# Altium project Control-Boards-v2.0.PrjPcb (part 10 of 10)
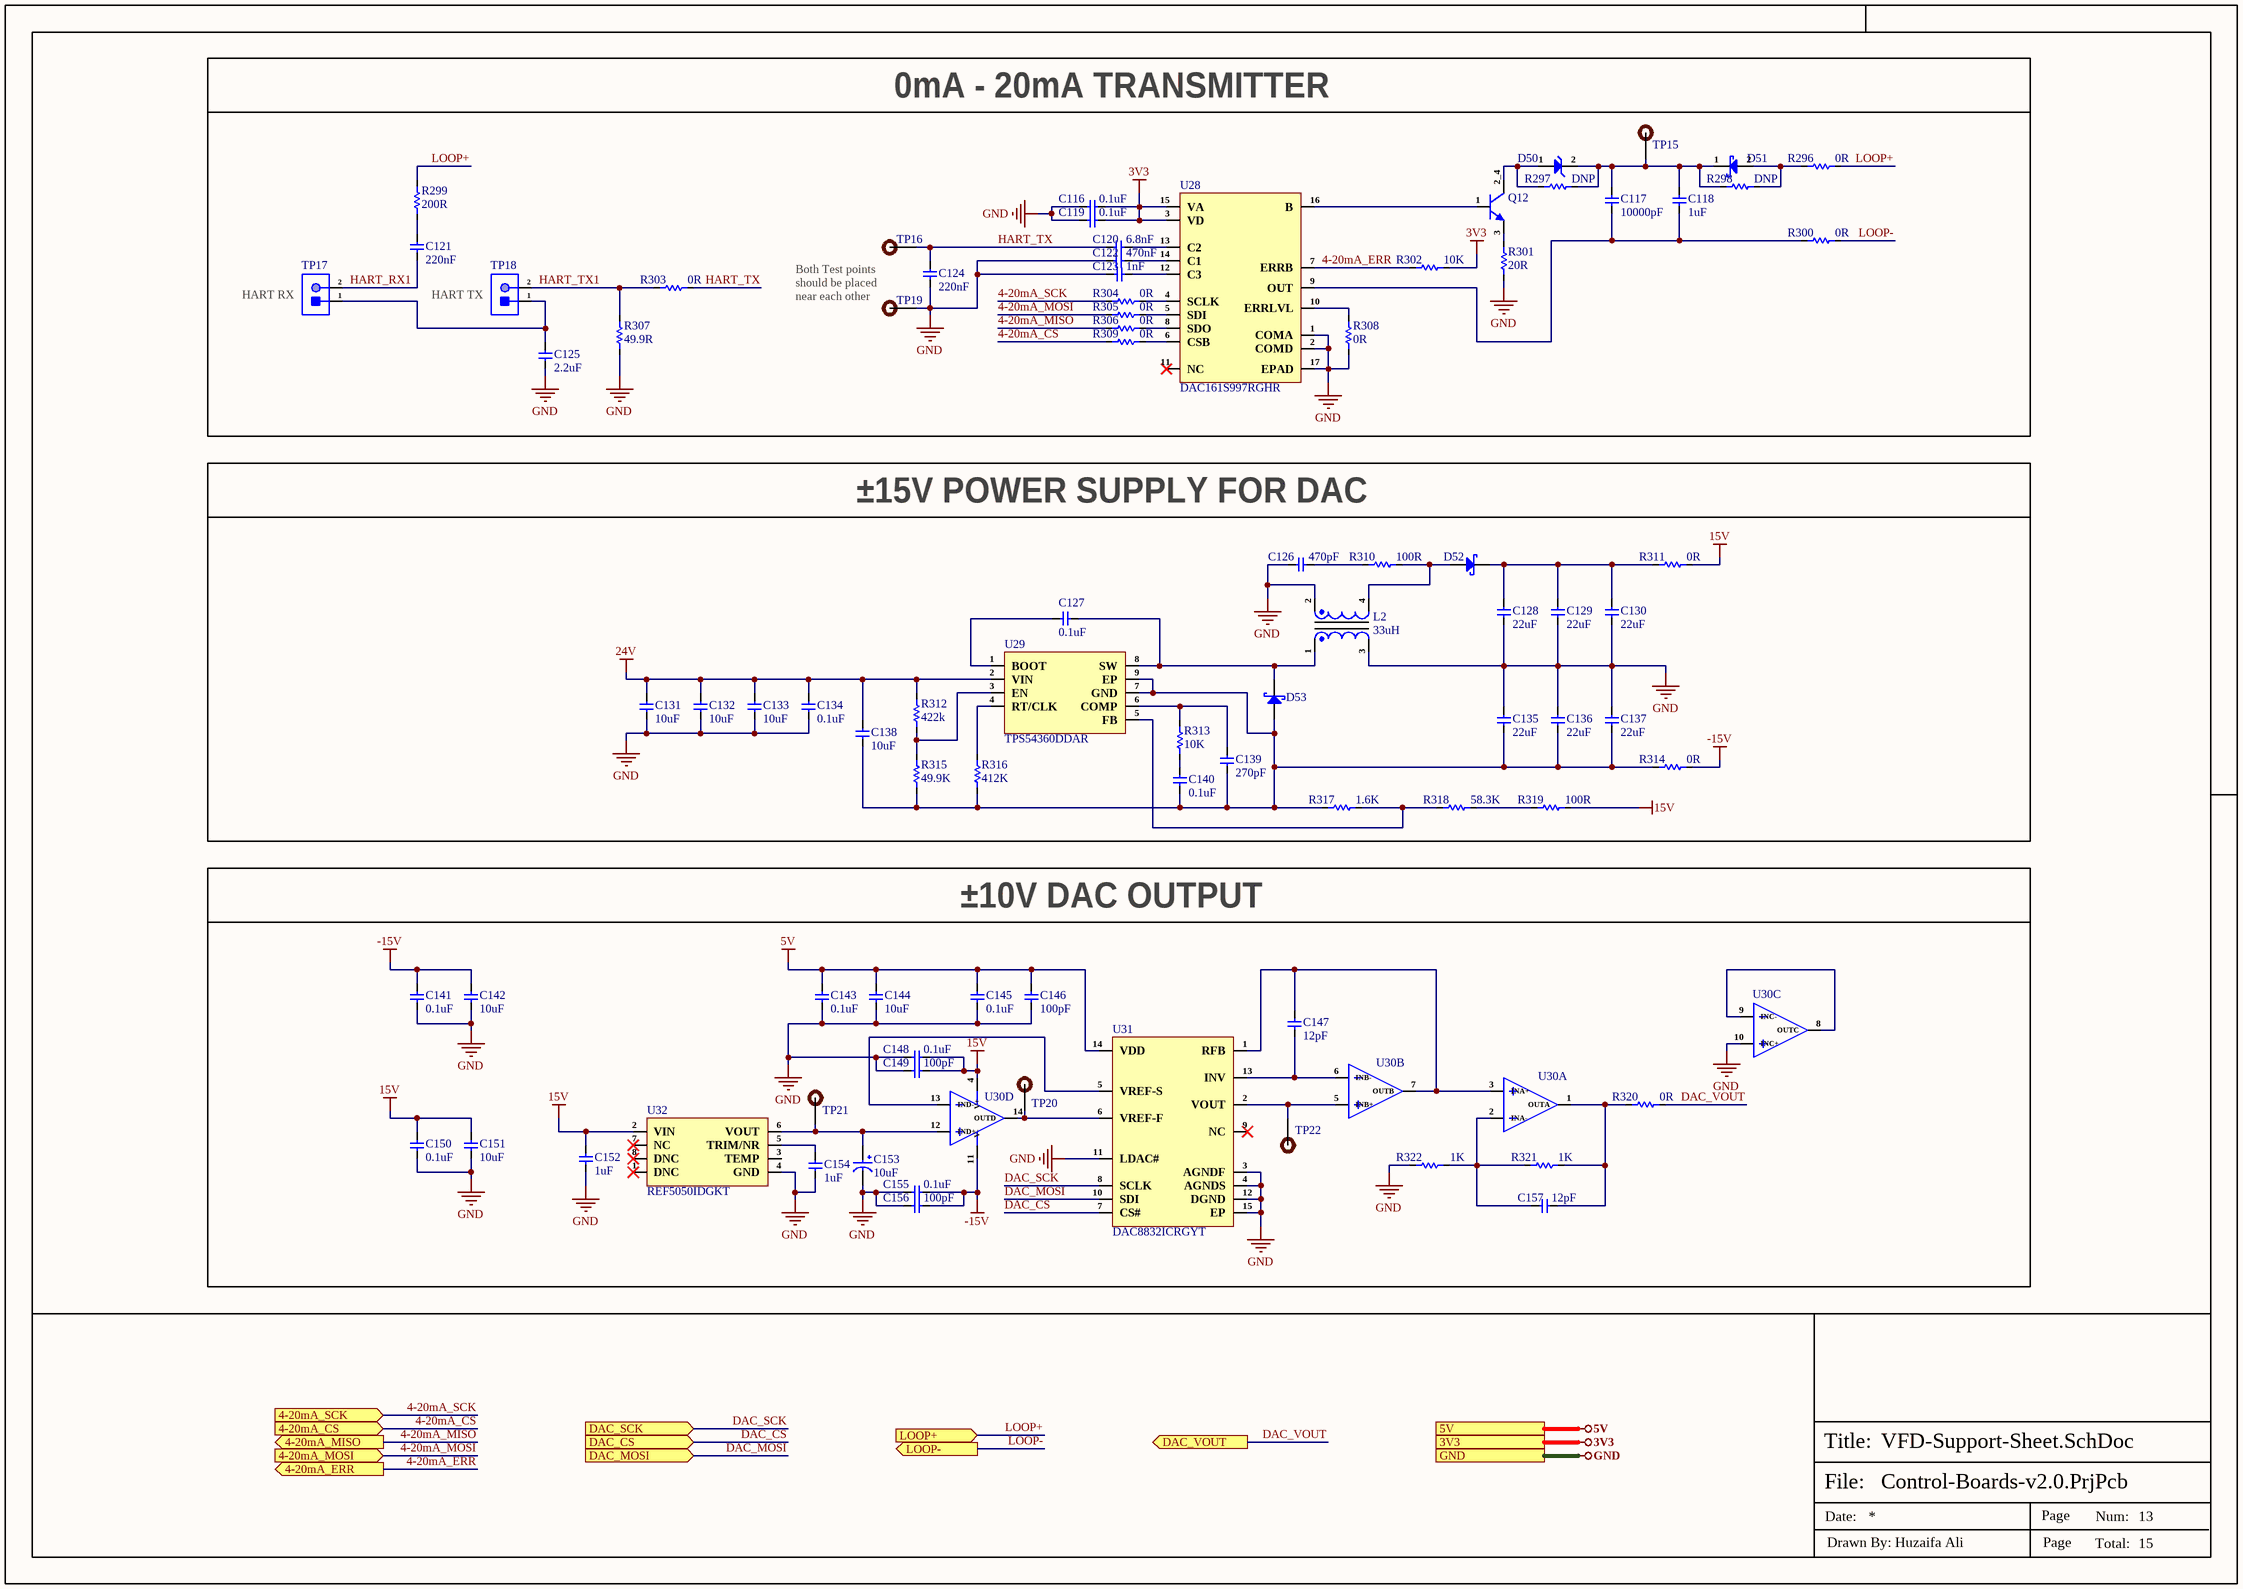
[diagram p16: VFD-Support-Sheet.SchDoc]

## Sheet VFD-Support-Sheet.SchDoc (continued)

### Library data of the parts (continued)
R312 = RT0805BRD07422KL: RES SMD 422K OHM 0.1% 1/8W 0805; Manufacturer: Yageo; Voltage Rating: 150V; Value: 422kR; Power Rating: 125mW; Temperature Coefficient: 25ppm/°C; Item Type: Resistor; Supplier 1: Digi-Key; Manufacturer Part Number: RT0805BRD07422KL; RoHS: Yes; Category: Chip SMD Resistors; Stock 1: 2917; Pricing 1: 1=0.38, 10=0.272, 100=0.1087, 500=0.07404, 1000=0.05357, 2500=0.04963 (USD); Case/Package: 0805; Case Code (Metric): 2012; Case Code (Imperial): 0805; Min Operating Temperature: -55°C; Max Operating Temperature: 155°C; Tolerance: 0.1%; Packaging: Tape and Reel; Termination: SMD/SMT; Voltage Rating (DC): 150V; Series: RT; Max Power Dissipation: 125mW; Number of Terminations: 2; Length: 2mm; Width: 1.25mm; Height: 500um; Lead Free: Lead Free; RoHS Compliant: Yes; ComponentLink1URL: https://datasheet.ciiva.com/12704/pyu-rt-1-to-0-05-rohs-l-4-12704463.pdf?src-supplier=Mouser; ComponentLink1Description: https://datasheet.ciiva.com/12704/pyu-rt-1-to-0-05-rohs-l-4-12704463.pdf?src-supplier=Mouser; Supplier Part Number 1: YAG4899CT-ND; LCSC Part Number: C865483
R315 = RC0805FR-0749K9L: RES 49.9K OHM 1% 1/8W 0805; Manufacturer: Yageo; Item Type: Resistor; Supplier: Future Electronics; Supplier Part Number: 3813284; Manufacturer Part Number: RC0805FR-0749K9L; RoHS: Yes; Category: Chip SMD Resistors; Stock: 665000; Pricing: 5000=0.0041, 25000=0.0025, 50000=0.0038, 125000=0.0024, 200000=0.0036, 500000=0.0023, 625000=0.0035, 1250000=0.0021, 2000000=0.0032 (USD); ComponentLink1URL: https://datasheet.ciiva.com/11808/0900766b8106beab-11808911.pdf?src-supplier=Rs; ComponentLink1Description: https://datasheet.ciiva.com/11808/0900766b8106beab-11808911.pdf?src-supplier=Rs; ComponentLink2URL: https://datasheet.ciiva.com/12656/rc0805-12656764.pdf?src-supplier=Mouser; ComponentLink2Description: https://datasheet.ciiva.com/12656/rc0805-12656764.pdf?src-supplier=Mouser; ComponentLink3URL: https://datasheet.ciiva.com/2456/pyu-r-int-thick-7-2456990.pdf?src-supplier=Digi-Key; ComponentLink3Description: https://datasheet.ciiva.com/2456/pyu-r-int-thick-7-2456990.pdf?src-supplier=Digi-Key; ComponentLink4URL: https://datasheet.ciiva.com/2456/pyu-r-int-thick-7-2456991.pdf?src-supplier=Digi-Key; ComponentLink4Description: https://datasheet.ciiva.com/2456/pyu-r-int-thick-7-2456991.pdf?src-supplier=Digi-Key; ComponentLink5URL: https://datasheet.ciiva.com/2456/pyu-r-int-thick-7-2456992.pdf?src-supplier=Digi-Key; ComponentLink5Description: https://datasheet.ciiva.com/2456/pyu-r-int-thick-7-2456992.pdf?src-supplier=Digi-Key; LCSC Part Number: C114540
R316 = RT0805BRD07412KL: RES SMD 412K OHM 0.1% 1/8W 0805; Manufacturer: Yageo; Item Type: Resistors; Value: 412kR; Power Rating: 125mW; Voltage Rating: 150V; Temperature Coefficient: 25ppm/°C; Supplier: Mouser; LCSC Part Number: C865478; Manufacturer Part Number: RT0805BRD07412KL; RoHS: Yes; Stock: 5000; Pricing: 1=0.16, 10=0.121, 50=0.095, 100=0.085, 1000=0.057, 10000=0.038 (USD); Case/Package: 0805; Case Code (Imperial): 0805; Case Code (Metric): 2012; Weight: 0.000194oz; Min Operating Temperature: -55°C; Max Operating Temperature: 155°C; Packaging: Tape and Reel; Tolerance: 0.1%; Termination: SMD/SMT; Voltage Rating (DC): 150V; Series: RT; Max Power Dissipation: 125mW; Number of Terminations: 2; Length: 2mm; Width: 1.2mm; Height: 0.5mm; Lead Free: Lead Free; RoHS Compliant: Yes; ComponentLink1URL: http://www.mouser.com/ds/2/447/yageodocoutput-1125656.pdf?src-supplier=Mouser; ComponentLink1Description: http://www.mouser.com/ds/2/447/yageodocoutput-1125656.pdf?src-supplier=Mouser; ComponentLink2URL: http://www.yageo.com/documents/recent/PYu-RT_1-to-0.01_RoHS_L_9.pdf?src-supplier=Digikey; ComponentLink2Description: http://www.yageo.com/documents/recent/PYu-RT_1-to-0.01_RoHS_L_9.pdf?src-supplier=Digikey
R317 = RT0402BRD071K6L: RES SMD 1.6K OHM 0.1% 1/16W 0402; Manufacturer: Yageo; Resistance: 1.6kR; Power Rating: 62.5mW; Voltage Rating: 50V; Temperature Coefficient: 25ppm/°C; Max Power Dissipation: 63mW; Item Type: Resistor; Supplier 1: Digi-Key; Manufacturer Part Number: RT0402BRD071K6L; RoHS: Yes; Category: Chip SMD Resistors; Stock 1: 20555; Pricing 1: 1=0.40000, 10=0.33600, 100=0.13130, 500=0.07938, 1000=0.05496, 2500=0.05038, 5000=0.04580 (USD); Case/Package: 0402; Case Code (Imperial): 0402; Case Code (Metric): 1005; Weight: 2.3E-05oz; Min Operating Temperature: -55°C; Max Operating Temperature: 125°C; Packaging: Tape and Reel; Tolerance: 0.1%; Package Quantity: 10000; Resistor Type: Thin Film; Termination: SMD/SMT; Number of Terminations: 2; Voltage Rating (DC): 50V; Series: RT; Length: 0.039inch; Width: 0.5mm; Height: 0.014inch; Lead Free: Lead Free; RoHS Compliant: Yes; ComponentLink1URL: https://datasheet.ciiva.com/2582/pyu-rt-1-to-0-05-rohs-l-5-2582211.pdf?src-supplier=Digi-Key; ComponentLink1Description: https://datasheet.ciiva.com/2582/pyu-rt-1-to-0-05-rohs-l-5-2582211.pdf?src-supplier=Digi-Key; LCSC Part Number: C852616; Supplier Part Number 1: YAG4199CT-ND
R318 = RT0402BRD0758K3L: RES SMD 58.3KOHM 0.1% 1/16W 0402; Manufacturer: Yageo; Item Type: Resistors; Supplier: Mouser; LCSC Part Number: C852851; Manufacturer Part Number: RT0402BRD0758K3L; RoHS: Yes; Stock: 10000; Pricing: 1=0.16, 10=0.121, 50=0.096, 100=0.086, 1000=0.057, 10000=0.038 (USD); ComponentLink1URL: https://datasheet.octopart.com/RT0402BRD0758K3L-Yageo-datasheet-164439670.pdf?src-supplier=Newark; ComponentLink1Description: https://datasheet.octopart.com/RT0402BRD0758K3L-Yageo-datasheet-164439670.pdf?src-supplier=Newark; ComponentLink2URL: http://www.yageo.com/documents/recent/PYu-RT_1-to-0.01_RoHS_L_9.pdf?src-supplier=Digikey; ComponentLink2Description: http://www.yageo.com/documents/recent/PYu-RT_1-to-0.01_RoHS_L_9.pdf?src-supplier=Digikey; ComponentLink3URL: https://www.yageo.com/upload/media/product/productsearch/datasheet/rchip/PYu-RT_1-to-0.01_RoHS_L_12.pdf?src-supplier=Digikey; ComponentLink3Description: https://www.yageo.com/upload/media/product/productsearch/datasheet/rchip/PYu-RT_1-to-0.01_RoHS_L_12.pdf?src-supplier=Digikey; ComponentLink4URL: https://datasheet.octopart.com/RT0402BRD0758K3L-Yageo-datasheet-166250672.pdf?src-supplier=Future+Electronics; ComponentLink4Description: https://datasheet.octopart.com/RT0402BRD0758K3L-Yageo-datasheet-166250672.pdf?src-supplier=Future+Electronics
R321 R322 = RC0402FR-071KL: RES 1K OHM 1% 1/16W 0402; Manufacturer: Yageo; Resistance: 1kR; Temperature Coefficient: 100ppm/°C; Voltage Rating (DC): 50V; Power Rating: 62.5mW; Max Power Dissipation: 63mW; Item Type: Resistor; Supplier 1: Avnet; Manufacturer Part Number: RC0402FR-071KL; RoHS: Yes; Category: Chip SMD Resistors; Stock 1: 13030000; Pricing 1: 10000=0.00085, 20000=0.00087, 40000=0.00084, 60000=0.00083, 80000=0.00079, 100000=0.00078, 1000000=0.00076 (USD); Case/Package: 0402; Number of Pins: 2; Case Code (Imperial): 0402; Case Code (Metric): 1005; Size Code: 0402; Min Operating Temperature: -55°C; Max Operating Temperature: 155°C; Resistor Type: Thick Film; Tolerance: 1%; Packaging: Tape and Reel; Voltage Rating: 50V; Termination: SMD/SMT; Features: Moisture Resistant; Series: RC; Number of Terminations: 2; Resistance Tolerance: 1%; Construction: Rectangular; Technology: THICK FILM; Length: 1mm; Width: 0.5mm; Height: 0.32mm; Depth: 0.5mm; Reach SVHC Compliant: Yes; Lead Free: Lead Free; RoHS Compliant: Yes; Military Standard: Not; ComponentLink1URL: https://datasheet.ciiva.com/11819/0900766b80c66297-11819477.pdf?src-supplier=RSComponents; ComponentLink1Description: https://datasheet.ciiva.com/11819/0900766b80c66297-11819477.pdf?src-supplier=RSComponents; ComponentLink2URL: https://datasheet.ciiva.com/7983/1018594-7983502.pdf?src-supplier=Element14; ComponentLink2Description: https://datasheet.ciiva.com/7983/1018594-7983502.pdf?src-supplier=Element14; ComponentLink3URL: https://datasheet.ciiva.com/22747/1018594-22747513.pdf?src-supplier=Element14; ComponentLink3Description: https://datasheet.ciiva.com/22747/1018594-22747513.pdf?src-supplier=Element14; ComponentLink4URL: https://datasheet.ciiva.com/12666/pyu-rc0402-51-rohs-l-6-r-12666741.pdf?src-supplier=Mouser; ComponentLink4Description: https://datasheet.ciiva.com/12666/pyu-rc0402-51-rohs-l-6-r-12666741.pdf?src-supplier=Mouser; ComponentLink5URL: https://datasheet.ciiva.com/7849/1018594-7849869.pdf?src-supplier=Element14; ComponentLink5Description: https://datasheet.ciiva.com/7849/1018594-7849869.pdf?src-supplier=Element14; ComponentLink6URL: https://datasheet.ciiva.com/7849/1018594-7849871.pdf?src-supplier=Element14; ComponentLink6Description: https://datasheet.ciiva.com/7849/1018594-7849871.pdf?src-supplier=Element14; ComponentLink7URL: https://datasheet.ciiva.com/17063/pyu-rc0402-51-rohs-l-6-r-17063193.pdf?src-supplier=Future+Electronics; ComponentLink7Description: https://datasheet.ciiva.com/17063/pyu-rc0402-51-rohs-l-6-r-17063193.pdf?src-supplier=Future+Electronics; Supplier Part Number 1: RC0402FR-071KL; LCSC Part Number: C106235
TP15 TP16 TP19-TP22 = TEST POINT: Test Point ON; Item Type: TEST POINT
TP17 TP18 = 2 Test Pad: Wire Connecting Pad; Item Type: Test Point; Manufacturer Part Number: 2 Test Pad
U28 = DAC161S997RGHR: IC DAC 16BIT 16WQFN; Manufacturer: Texas Instruments; Supplier: Mouser; LCSC Part Number: C90500; Manufacturer Part Number: DAC161S997RGHR; RoHS: Yes; Item Type: IC; Stock: 4693; Pricing: 1=5.54, 10=4.08, 50=4.08, 100=3.71, 1000=3.03, 10000=2.74 (USD); ComponentLink1URL: https://datasheet.ciiva.com/18633/dac161s997-18633093.pdf?src-supplier=Digikey; ComponentLink1Description: https://datasheet.ciiva.com/18633/dac161s997-18633093.pdf?src-supplier=Digikey; ComponentLink2URL: https://datasheet.ciiva.com/29897/dac161s997-29897307.pdf?src-supplier=Avnet; ComponentLink2Description: https://datasheet.ciiva.com/29897/dac161s997-29897307.pdf?src-supplier=Avnet
U29 = TPS54360DDAR: IC REG BCK SPLIT RAIL ADJ 8SOPWR; Manufacturer: Texas Instruments; Supplier: Mouser; LCSC Part Number: C44377; Manufacturer Part Number: TPS54360DDAR; RoHS: Yes; Item Type: IC; Stock: 2440; Pricing: 1=4.37, 10=3.05, 50=3.05, 100=2.76, 1000=2.47, 10000=2.31 (USD); ComponentLink1URL: https://datasheet.ciiva.com/12221/tps54360-109421-12221526.pdf?src-supplier=Mouser; ComponentLink1Description: https://datasheet.ciiva.com/12221/tps54360-109421-12221526.pdf?src-supplier=Mouser; ComponentLink2URL: https://datasheet.ciiva.com/14833/2976tps54360-14833745.pdf?src-supplier=Arrow+Electronics; ComponentLink2Description: https://datasheet.ciiva.com/14833/2976tps54360-14833745.pdf?src-supplier=Arrow+Electronics; ComponentLink3URL: https://datasheet.ciiva.com/14377/tps54360-14377976.pdf?src-supplier=Avnet; ComponentLink3Description: https://datasheet.ciiva.com/14377/tps54360-14377976.pdf?src-supplier=Avnet; ComponentLink4URL: https://datasheet.ciiva.com/41798/tps54360-41798794.pdf?src-supplier=Digikey; ComponentLink4Description: https://datasheet.ciiva.com/41798/tps54360-41798794.pdf?src-supplier=Digikey
U30 = OPA4192IPWR: IC OPAMP GP 4 CIRCUIT 14TSSOP; Manufacturer: Texas Instruments; Supplier: Mouser; LCSC Part Number: C2057935; Manufacturer Part Number: OPA4192IPWR; RoHS: Yes; Item Type: IC; Stock: 4607; Pricing: 1=6.33, 10=4.87, 50=4.5, 100=4.1, 1000=3.67, 10000=3.59 (USD); ComponentLink1URL: http://www.ti.com/general/docs/suppproductinfo.tsp?distId=10&amp;gotoUrl=http%3A%2F%2Fwww.ti.com%2Flit%2Fgpn%2Fopa4192&src-supplier=Digikey; ComponentLink1Description: http://www.ti.com/general/docs/suppproductinfo.tsp?distId=10&amp;gotoUrl=http%3A%2F%2Fwww.ti.com%2Flit%2Fgpn%2Fopa4192&src-supplier=Digikey; ComponentLink2URL: http://www.ti.com/lit/gpn/opa4192?src-supplier=Mouser; ComponentLink2Description: http://www.ti.com/lit/gpn/opa4192?src-supplier=Mouser
U31 = DAC8832ICRGYT: IC DAC 16BIT V-OUT 14VQFN; Manufacturer: Texas Instruments; Supplier: Mouser; LCSC Part Number: C2876764; Manufacturer Part Number: DAC8832ICRGYT; RoHS: Yes; Item Type: IC; Stock: 307; Pricing: 1=16.19, 10=12.83, 50=11.99, 100=11.06, 1000=10.23, 10000=10.23 (USD); ComponentLink1URL: https://datasheet.ciiva.com/12285/sbas380b-190797-12285552.pdf?src-supplier=Mouser; ComponentLink1Description: https://datasheet.ciiva.com/12285/sbas380b-190797-12285552.pdf?src-supplier=Mouser; ComponentLink2URL: https://datasheet.ciiva.com/15147/getdatasheetpartid-247745-15147072.pdf?src-supplier=Verical; ComponentLink2Description: https://datasheet.ciiva.com/15147/getdatasheetpartid-247745-15147072.pdf?src-supplier=Verical; ComponentLink3URL: https://datasheet.ciiva.com/41460/001186155-da-01-en-ic-dac-16bit-vo-dac8832icrgyt-qfn-14-tid-41460090.pdf?src-supplier=Conrad; ComponentLink3Description: https://datasheet.ciiva.com/41460/001186155-da-01-en-ic-dac-16bit-vo-dac8832icrgyt-qfn-14-tid-41460090.pdf?src-supplier=Conrad; ComponentLink4URL: https://datasheet.ciiva.com/14254/sbas380b-14254541.pdf?src-supplier=Avnet; ComponentLink4Description: https://datasheet.ciiva.com/14254/sbas380b-14254541.pdf?src-supplier=Avnet; ComponentLink5URL: https://datasheet.ciiva.com/1364/dac8832-1364376.pdf?src-supplier=Digikey; ComponentLink5Description: https://datasheet.ciiva.com/1364/dac8832-1364376.pdf?src-supplier=Digikey; ComponentLink6URL: https://datasheet.ciiva.com/1364/dac8832-1364377.pdf?src-supplier=Digikey; ComponentLink6Description: https://datasheet.ciiva.com/1364/dac8832-1364377.pdf?src-supplier=Digikey; ComponentLink7URL: https://datasheet.ciiva.com/1364/dac8832-1364378.pdf?src-supplier=Digikey; ComponentLink7Description: https://datasheet.ciiva.com/1364/dac8832-1364378.pdf?src-supplier=Digikey
U32 = REF5050IDGKT: IC VREF SERIES 0.05% 8VSSOP; Manufacturer: Texas Instruments; Supplier: Mouser; LCSC Part Number: C2156540; Manufacturer Part Number: REF5050IDGKT; RoHS: Yes; Item Type: IC; Stock: 701; Pricing: 1=7.97, 10=6.18, 50=5.73, 100=5.23, 1000=4.86, 10000=4.86 (USD); ComponentLink1URL: https://datasheet.ciiva.com/22666/1885920-22666106.pdf?src-supplier=Element14; ComponentLink1Description: https://datasheet.ciiva.com/22666/1885920-22666106.pdf?src-supplier=Element14; ComponentLink2URL: https://datasheet.ciiva.com/2007/ref5020-2007552.pdf?src-supplier=Digikey; ComponentLink2Description: https://datasheet.ciiva.com/2007/ref5020-2007552.pdf?src-supplier=Digikey; ComponentLink3URL: https://datasheet.ciiva.com/2007/ref5020-2007553.pdf?src-supplier=Digikey; ComponentLink3Description: https://datasheet.ciiva.com/2007/ref5020-2007553.pdf?src-supplier=Digikey; ComponentLink4URL: https://datasheet.ciiva.com/2007/ref5020-2007554.pdf?src-supplier=Digikey; ComponentLink4Description: https://datasheet.ciiva.com/2007/ref5020-2007554.pdf?src-supplier=Digikey; ComponentLink5URL: https://datasheet.ciiva.com/14197/ref5050-14197087.pdf?src-supplier=Avnet; ComponentLink5Description: https://datasheet.ciiva.com/14197/ref5050-14197087.pdf?src-supplier=Avnet

## Sheet VFD-Support-Sheet2.SchDoc
size 420 x 297 mm; SheetNumber: 14; SheetTotal: 15
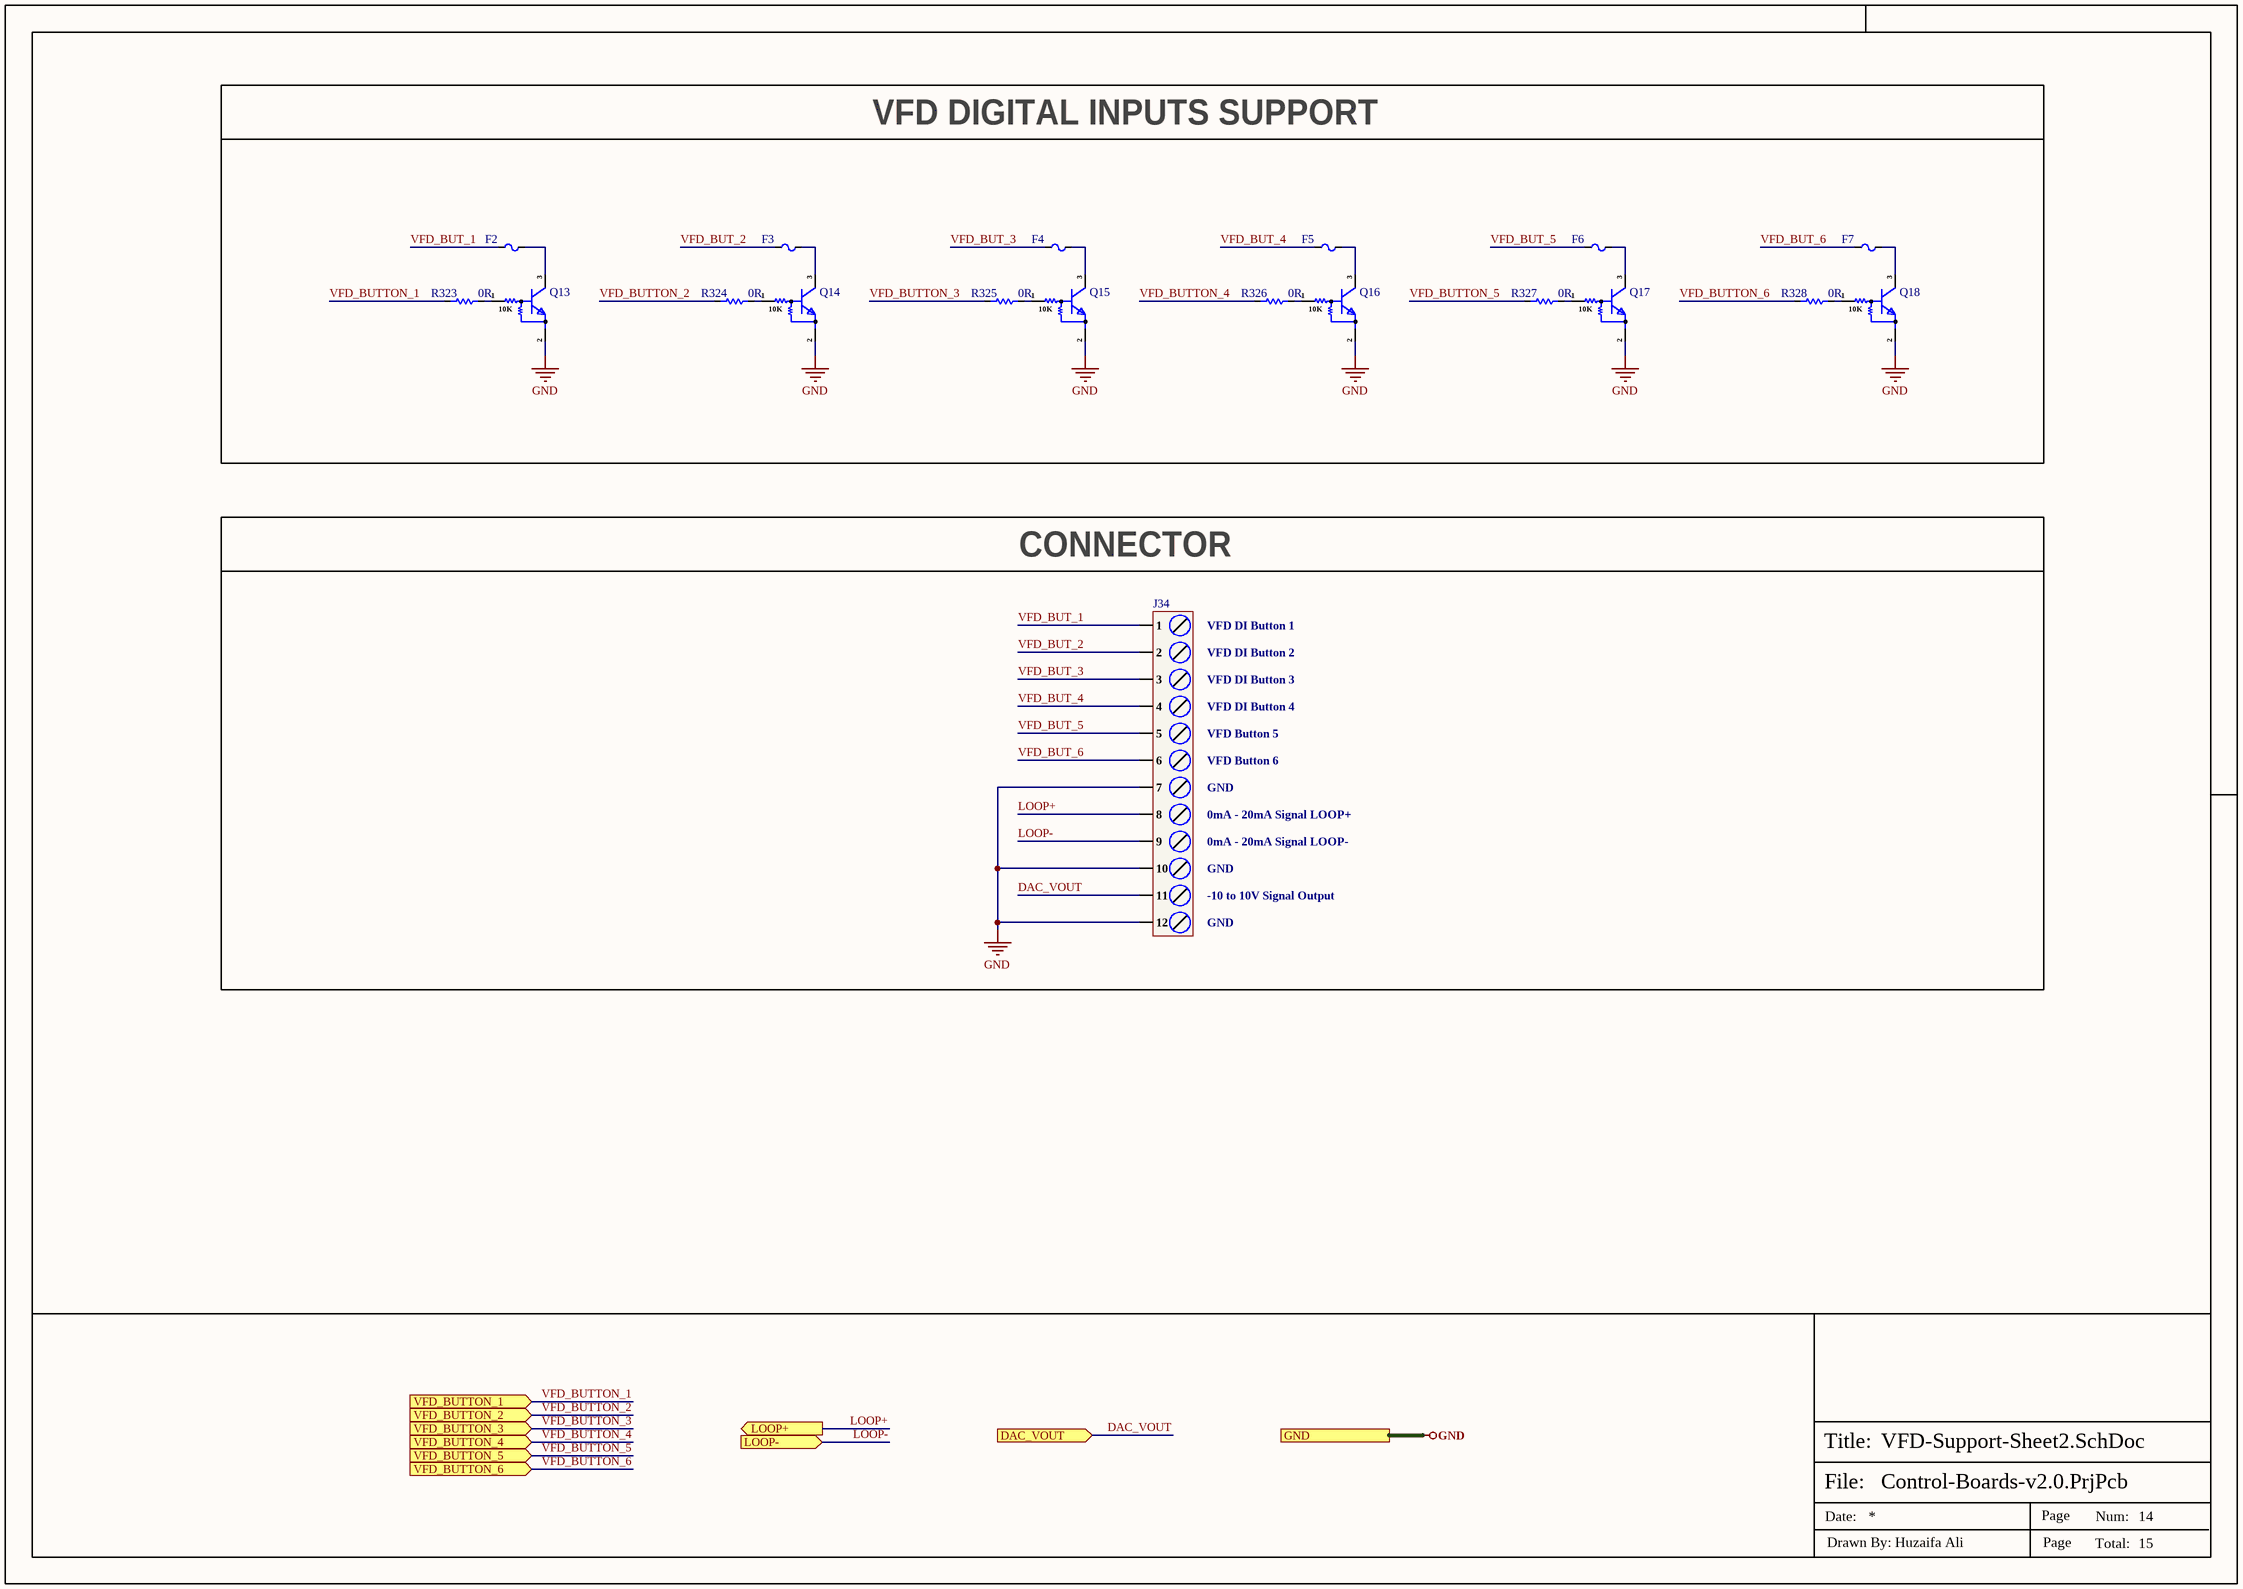
[diagram p14: VFD-Support-Sheet2.SchDoc]

### Parts
F2  SMD0603-003/30N  [Fuse-0603]  (value not drawn)
F3  SMD0603-003/30N  [Fuse-0603]  (value not drawn)
F4  SMD0603-003/30N  [Fuse-0603]  (value not drawn)
F5  SMD0603-003/30N  [Fuse-0603]  (value not drawn)
F6  SMD0603-003/30N  [Fuse-0603]  (value not drawn)
F7  SMD0603-003/30N  [Fuse-0603]  (value not drawn)
J34  JL301-50012U01  [JL301-50012U01]  (value not drawn)
Q13  LMUN2211LT1G  [SOT-23]  (value not drawn)
Q14  LMUN2211LT1G  [SOT-23]  (value not drawn)
Q15  LMUN2211LT1G  [SOT-23]  (value not drawn)
Q16  LMUN2211LT1G  [SOT-23]  (value not drawn)
Q17  LMUN2211LT1G  [SOT-23]  (value not drawn)
Q18  LMUN2211LT1G  [SOT-23]  (value not drawn)
R323  0R  [Res-0402]
R324  0R  [Res-0402]
R325  0R  [Res-0402]
R326  0R  [Res-0402]
R327  0R  [Res-0402]
R328  0R  [Res-0402]

### Blocks framed on the sheet
VFD DIGITAL INPUTS SUPPORT: F2-F7 Q13-Q18 R323-R328
CONNECTOR: J34

### Ports
DAC_VOUT (in, see Top-Sheet[5D], VFD-Support-Sheet[4D]), GND (see Top-Sheet[5C], Buttons-Lights-Sensors-Sheet[4D], CAN-Sheet[6D], Controller-Sheet-1[4D], Controller-Sheet-2[4D], Controller-Sheet-3[4D], EtherCAT-Sheet[1D], Ethernet-PHY-Sheet[4D], Extra-DIOs[4D], Power-Sheet[4D], RS232-Sheet[5D], RS485-Sheet[5D], USB-Sheet[4D], VFD-Support-Sheet[4D]), LOOP+ (out, see Top-Sheet[5D], VFD-Support-Sheet[3D]), LOOP- (in, see Top-Sheet[5D], VFD-Support-Sheet[3D]), VFD_BUTTON_1 (in, see Top-Sheet[5C]), VFD_BUTTON_2 (in, see Top-Sheet[5C]), VFD_BUTTON_3 (in, see Top-Sheet[5C]), VFD_BUTTON_4 (in, see Top-Sheet[5C]), VFD_BUTTON_5 (in, see Top-Sheet[5D]), VFD_BUTTON_6 (in, see Top-Sheet[5D])

### Nets
GND: J34.7 J34.10 J34.12 Q13.2(E) Q14.2(E) Q15.2(E) Q16.2(E) Q17.2(E) Q18.2(E) ; port GND
DAC_VOUT: J34.11 ; port DAC_VOUT
LOOP+: J34.8 ; port LOOP+
LOOP-: J34.9 ; port LOOP-
VFD_BUT_1: F2.1 J34.1
VFD_BUT_2: F3.1 J34.2
VFD_BUT_3: F4.1 J34.3
VFD_BUT_4: F5.1 J34.4
VFD_BUT_5: F6.1 J34.5
VFD_BUT_6: F7.1 J34.6
VFD_BUTTON_1: R323.2 ; port VFD_BUTTON_1  [project net DO_PE0]
VFD_BUTTON_2: R324.2 ; port VFD_BUTTON_2  [project net DO_PE1]
VFD_BUTTON_3: R325.2 ; port VFD_BUTTON_3  [project net DO_PE11]
VFD_BUTTON_4: R326.2 ; port VFD_BUTTON_4  [project net DO_PE12]
VFD_BUTTON_5: R327.2 ; port VFD_BUTTON_5  [project net DO_PG5]
VFD_BUTTON_6: R328.2 ; port VFD_BUTTON_6  [project net DO_PG6]
NetF2_2: F2.2 Q13.3(C)
NetF3_2: F3.2 Q14.3(C)
NetF4_2: F4.2 Q15.3(C)
NetF5_2: F5.2 Q16.3(C)
NetF6_2: F6.2 Q17.3(C)
NetF7_2: F7.2 Q18.3(C)
NetQ13_1: Q13.1(B) R323.1
NetQ14_1: Q14.1(B) R324.1
NetQ15_1: Q15.1(B) R325.1
NetQ16_1: Q16.1(B) R326.1
NetQ17_1: Q17.1(B) R327.1
NetQ18_1: Q18.1(B) R328.1

### Notes on the sheet
- VFD DI Button 1
- VFD DI Button 2
- VFD DI Button 3
- VFD DI Button 4
- VFD Button 5
- GND
- VFD Button 6
- 0mA - 20mA Signal LOOP+
- 0mA - 20mA Signal LOOP-
- -10 to 10V Signal Output
- File:
- Title:
- Date:
- Page
- Num:
- Total:
- Drawn By: Huzaifa Ali
- (in symbol LMUN2211LT1G) 10K

### Library data of the parts
F2-F7 = SMD0603-003/30N: 30V 30mA 20A 90mA 0603 Resettable Fuses ROHS; Manufacturer: BHFUSE; Supplier: LCSC; LCSC Part Number: C2687870; Manufacturer Part Number: SMD0603-003/30N; RoHS: No; ComponentLink1Description: LCSC; ComponentLink1URL: https://www.lcsc.com/product-detail/Resettable-Fuses_BORN-SMD0603-003-30N_C2687870.html
J34 = JL301-50012U01: 1x12P -40℃~+105℃ 15A 300V Blue 12~24 Direct Insert 5mm 1 12 Plugin,P=5mm Screw Terminal Blocks ROHS; Manufacturer: JILN; Manufacturer Part Number: JL301-50012U01; Package: Plugin,P=5mm; LCSC Part Number: C1509686; Item Type: Screw Terminal; ComponentLink1Description: LCSC; ComponentLink1URL: https://www.lcsc.com/product-detail/Screw-Terminal-Blocks_JILN-JL301-50012U01_C1509686.html
Q13-Q18 = LMUN2211LT1G: NPN 246mW 100mA 50V SOT-23 Digital Transistors ROHS; Manufacturer: LRC; Item Type: Mosfet; Manufacturer Part Number: LMUN2211LT1G; Package: SOT-23; LCSC Part Number: C12775; ComponentLink1Description: LCSC; ComponentLink1URL: https://www.lcsc.com/product-detail/Digital-Transistors_LRC-LMUN2211LT1G_C12775.html
R323-R328 = RC0402FR-070RL: as R304-R306 on sheet VFD-Support-Sheet; Supplier 1: Mouser; Manufacturer Part Number: RC0402FR-070RL; RoHS: Yes; Stock 1: 8556842; Pricing 1: 1=0.10000, 10=0.01400, 50=0.01400, 100=0.00600, 1000=0.00300, 5000=0.00200, 10000=0.00100 (USD); Mount: Surface Mount; Case/Package: 0402; Contact Plating: Tin,Matte; Case Code (Imperial): 0402; Case Code (Metric): 1005; Size Code: 0402; Min Operating Temperature: -55°C; Max Operating Temperature: 155°C; Resistance: 0R; Resistor Type: Thick Film; Packaging: Tape and Reel; Termination: SMD/SMT; Features: Moisture Resistant; Series: RC; Number of Terminations: 2; Length: 1mm; Width: 0.5mm; Height: 0.35mm; Radiation Hardening: No; Lead Free: Lead Free; RoHS Compliant: Yes; ComponentLink1URL: https://datasheet.ciiva.com/8896/pyu-rc0402-51-rohs-l-6-8896149.pdf?src-supplier=Avnet; ComponentLink1Description: https://datasheet.ciiva.com/8896/pyu-rc0402-51-rohs-l-6-8896149.pdf?src-supplier=Avnet; ComponentLink2URL: https://datasheet.ciiva.com/16790/pyu-rc0402-51-rohs-l-6-r-16790444.pdf?src-supplier=Future+Electronics; ComponentLink2Description: https://datasheet.ciiva.com/16790/pyu-rc0402-51-rohs-l-6-r-16790444.pdf?src-supplier=Future+Electronics; Supplier Part Number 1: 603-RC0402FR-070RL; LCSC Part Number: C106231

## Nets that join several sheets
3V3: Power-Sheet (D5.2 F1.2 R9.1), Controller-Sheet-1 (26 pins), Controller-Sheet-2 (8 pins), Ethernet-PHY-Sheet (8 pins), USB-Sheet (9 pins), CAN-Sheet (12 pins), RS485-Sheet (9 pins), RS232-Sheet (14 pins), EtherCAT-Sheet (27 pins), Buttons-Lights-Sensors-Sheet (8 pins), VFD-Support-Sheet (5 pins)
5V: Power-Sheet (13 pins), Controller-Sheet-2 (R57.2), USB-Sheet (U6.5), CAN-Sheet (10 pins), RS485-Sheet (C83.2 C85.2 LED14.2 LED15.2), RS232-Sheet (C75.2 C81.2 LED12.2 LED13.2), Buttons-Lights-Sensors-Sheet (J36.1 J36.4 J36.7 J36.10), VFD-Support-Sheet (5 pins)
24V: Power-Sheet (13 pins), Buttons-Lights-Sensors-Sheet (16 pins), VFD-Support-Sheet (7 pins)
GND: Power-Sheet (33 pins), Controller-Sheet-1 (26 pins), Controller-Sheet-2 (16 pins), Controller-Sheet-3 (J4.3), Ethernet-PHY-Sheet (20 pins), USB-Sheet (21 pins), CAN-Sheet (44 pins), RS485-Sheet (24 pins), RS232-Sheet (16 pins), EtherCAT-Sheet (46 pins), Extra-DIOs (9 pins), Buttons-Lights-Sensors-Sheet (37 pins), VFD-Support-Sheet (49 pins), VFD-Support-Sheet2 (9 pins)
SHGND: Power-Sheet (J2.3), Ethernet-PHY-Sheet (C52.1 J5.13 J5.14), USB-Sheet (7 pins), EtherCAT-Sheet (6 pins)
4-20mA_CS: Controller-Sheet-3 (R66.1), VFD-Support-Sheet (R309.1)
4-20mA_ERR: Controller-Sheet-3 (R65.1), VFD-Support-Sheet (R302.1 U28.7)
4-20mA_MISO: Controller-Sheet-3 (R68.1), VFD-Support-Sheet (R306.1)
4-20mA_MOSI: Controller-Sheet-3 (R70.1), VFD-Support-Sheet (R305.1)
4-20mA_SCK: Controller-Sheet-3 (R64.1), VFD-Support-Sheet (R304.1)
485_DIN_1: Controller-Sheet-3 (R72.2), RS485-Sheet (U15.4)
485_DIN_2: Controller-Sheet-2 (R48.2), RS485-Sheet (U16.4)
485_DIN_3: Controller-Sheet-2 (R54.2), RS485-Sheet (U17.4)
485_ROUT_1: Controller-Sheet-3 (R74.2), RS485-Sheet (U15.1)
485_ROUT_2: Controller-Sheet-2 (R49.2), RS485-Sheet (U16.1)
485_ROUT_3: Controller-Sheet-3 (R63.2), RS485-Sheet (U17.1)
BUZ_EN: Controller-Sheet-3 (R86.2), Buttons-Lights-Sensors-Sheet (R275.1)
CAN1_RXD: Controller-Sheet-3 (R59.2), CAN-Sheet (R164.1)
CAN1_SHDN: Controller-Sheet-3 (R88.2), CAN-Sheet (R167.1)
CAN1_STB: Controller-Sheet-3 (R90.2), CAN-Sheet (R160.1)
CAN1_TXD: Controller-Sheet-3 (R61.2), CAN-Sheet (R161.1)
CAN2_RXD: Controller-Sheet-2 (R27.1), CAN-Sheet (R177.1)
CAN2_SHDN: Controller-Sheet-3 (R92.2), CAN-Sheet (R180.1)
CAN2_STB: Controller-Sheet-3 (R94.2), CAN-Sheet (R172.1)
CAN2_TXD: Controller-Sheet-2 (R41.1), CAN-Sheet (R175.1)
CAN3_RXD: Controller-Sheet-3 (R80.2), CAN-Sheet (R190.1)
CAN3_SHDN: Controller-Sheet-3 (R96.2), CAN-Sheet (R193.1)
CAN3_STB: Controller-Sheet-3 (R98.2), CAN-Sheet (R187.1)
CAN3_TXD: Controller-Sheet-3 (R82.2), CAN-Sheet (R188.1)
CHIP_EN_1: Controller-Sheet-3 (R116.1), RS232-Sheet (R203.2 U13.14)
CHIP_EN_2: Controller-Sheet-3 (R118.1), RS232-Sheet (R212.2 U14.14)
CHIP_INVALID_1: Controller-Sheet-3 (R105.1), RS232-Sheet (U13.7)
CHIP_INVALID_2: Controller-Sheet-3 (R107.1), RS232-Sheet (U14.7)
DAC_CS: Controller-Sheet-3 (R100.2), VFD-Support-Sheet (U31.7)
DAC_MOSI: Controller-Sheet-3 (R106.2), VFD-Support-Sheet (U31.10)
DAC_SCK: Controller-Sheet-3 (R102.2), VFD-Support-Sheet (U31.8)
DAC_VOUT: VFD-Support-Sheet (R320.2), VFD-Support-Sheet2 (J34.11)
DI_PE7: Controller-Sheet-3 (R71.1), Buttons-Lights-Sensors-Sheet (R277.1 U21.4)
DI_PE8: Controller-Sheet-3 (R73.1), Buttons-Lights-Sensors-Sheet (R280.1 U22.4)
DI_PE9: Controller-Sheet-3 (R75.1), Buttons-Lights-Sensors-Sheet (R276.1 U20.4)
DI_PE10: Controller-Sheet-3 (R77.1), Buttons-Lights-Sensors-Sheet (R281.1 U23.4)
DI_PE13: Controller-Sheet-3 (R83.1), Buttons-Lights-Sensors-Sheet (R291.1 U26.4)
DI_PE14: Controller-Sheet-3 (R85.1), Buttons-Lights-Sensors-Sheet (R286.1 U25.4)
DI_PE15: Controller-Sheet-3 (R87.1), Buttons-Lights-Sensors-Sheet (R292.1 U27.4)
DI_PG0: Controller-Sheet-3 (R89.1), Buttons-Lights-Sensors-Sheet (R285.1 U24.4)
DI_PG1: Controller-Sheet-3 (R91.1), Buttons-Lights-Sensors-Sheet (D42.2 R284.1)
DI_PG2: Controller-Sheet-3 (R93.1), Buttons-Lights-Sensors-Sheet (D45.2 R289.1)
DI_PG3: Controller-Sheet-3 (R95.1), Buttons-Lights-Sensors-Sheet (D46.2 R290.1)
DI_PG4: Controller-Sheet-3 (R97.1), Buttons-Lights-Sensors-Sheet (D49.2 R295.1)
DIN_1: Controller-Sheet-2 (R29.1), RS232-Sheet (R206.2 U13.8)
DIN_2: Controller-Sheet-3 (R67.2), RS232-Sheet (R215.2 U14.8)
DIO_PA0: Controller-Sheet-2 (R17.2), Extra-DIOs (D54.2 D58.2 R329.1)
DIO_PA3: Controller-Sheet-2 (R23.2), Extra-DIOs (D55.2 D59.2 R330.1)
DIO_PA4: Controller-Sheet-2 (R25.2), EtherCAT-Sheet (U18.34)
DIO_PA5: Controller-Sheet-2 (R26.2), EtherCAT-Sheet (U18.18)
DIO_PA6: Controller-Sheet-2 (R28.2), Extra-DIOs (D56.2 D60.2 R331.1)
DIO_PB2: Controller-Sheet-2 (R22.1), Extra-DIOs (D57.2 D61.2 R332.1)
DO_PD11: Controller-Sheet-3 (R78.2), Buttons-Lights-Sensors-Sheet (R273.1)
DO_PD14: Controller-Sheet-3 (R84.2), Buttons-Lights-Sensors-Sheet (R274.1)
DO_PE0: Controller-Sheet-3 (R60.1), VFD-Support-Sheet2 (R323.2)
DO_PE1: Controller-Sheet-3 (R62.1), VFD-Support-Sheet2 (R324.2)
DO_PE11: Controller-Sheet-3 (R79.1), VFD-Support-Sheet2 (R325.2)
DO_PE12: Controller-Sheet-3 (R81.1), VFD-Support-Sheet2 (R326.2)
DO_PF10: Controller-Sheet-3 (R108.2), RS485-Sheet (R225.1 U15.2 U15.3)
DO_PF11: Controller-Sheet-3 (R109.2), RS485-Sheet (R231.1 U16.2 U16.3)
DO_PF12: Controller-Sheet-3 (R111.2), RS485-Sheet (R236.1 U17.2 U17.3)
DO_PF13: Controller-Sheet-3 (R113.2), Buttons-Lights-Sensors-Sheet (R272.1)
DO_PG5: Controller-Sheet-3 (R99.1), VFD-Support-Sheet2 (R327.2)
DO_PG6: Controller-Sheet-3 (R101.1), VFD-Support-Sheet2 (R328.2)
ETHCAT_CS: Controller-Sheet-2 (R39.1), EtherCAT-Sheet (R264.2)
ETHCAT_MISO: Controller-Sheet-2 (R43.1), EtherCAT-Sheet (R265.2)
ETHCAT_MOSI: Controller-Sheet-2 (R44.1), EtherCAT-Sheet (R266.2)
ETHCAT_SCK: Controller-Sheet-2 (R35.1), EtherCAT-Sheet (R262.2)
LAN_RMII_CRS_DV: Controller-Sheet-2 (R30.2), Ethernet-PHY-Sheet (R136.1)
LAN_RMII_MDC: Controller-Sheet-2 (R45.2), Ethernet-PHY-Sheet (U5.13)
LAN_RMII_MDIO: Controller-Sheet-2 (R21.2), Ethernet-PHY-Sheet (R122.2 U5.12)
LAN_RMII_REF_CLK: Controller-Sheet-2 (R19.2), Ethernet-PHY-Sheet (R140.1)
LAN_RMII_RXD0: Controller-Sheet-2 (R46.2), Ethernet-PHY-Sheet (R130.1)
LAN_RMII_RXD1: Controller-Sheet-2 (R47.2), Ethernet-PHY-Sheet (R131.1)
LAN_RMII_TX_EN: Controller-Sheet-3 (R110.1), Ethernet-PHY-Sheet (U5.16)
LAN_RMII_TXD0: Controller-Sheet-3 (R114.1), Ethernet-PHY-Sheet (U5.17)
LAN_RMII_TXD1: Controller-Sheet-3 (R112.1), Ethernet-PHY-Sheet (U5.18)
LED1_DIN: Controller-Sheet-2 (R58.2), CAN-Sheet (LED7.4)
LED5_DOUT: CAN-Sheet (R202.2), RS232-Sheet (LED12.4)
LED7_DOUT: RS485-Sheet (LED14.4), RS232-Sheet (R220.2)
LED9_DOUT: Top-Sheet (TP23.1), RS485-Sheet (R232.2)
LOOP+: VFD-Support-Sheet (R296.2 R299.2), VFD-Support-Sheet2 (J34.8)
LOOP-: VFD-Support-Sheet (R300.2), VFD-Support-Sheet2 (J34.9)
NRST_ETH: Controller-Sheet-2 (5 pins), Ethernet-PHY-Sheet (R137.1)
ROUT_1: Controller-Sheet-2 (R31.1), RS232-Sheet (R207.2 U13.6)
ROUT_2: Controller-Sheet-3 (R69.2), RS232-Sheet (R216.2 U14.6)
RS485-3_N: CAN-Sheet (J14.2 J14.10 J14.18 J14.26), RS485-Sheet (7 pins)
RS485-3_P: CAN-Sheet (J14.1 J14.9 J14.17 J14.25), RS485-Sheet (7 pins)
SPI5_MISO: Top-Sheet (TP24.1), Controller-Sheet-3 (R104.2)
UART4_RX: Controller-Sheet-2 (R52.2), USB-Sheet (R154.2)
UART4_TX: Controller-Sheet-2 (R51.2), USB-Sheet (R152.2)
USB_FS_ID: Controller-Sheet-2 (R34.2), USB-Sheet (D14.1 J6.4)
USB_FS_N: Controller-Sheet-2 (R37.2), USB-Sheet (U7.1)
USB_FS_OVCR: Controller-Sheet-3 (R103.1), USB-Sheet (LED5.2 R143.1 U6.3)
USB_FS_P: Controller-Sheet-2 (R38.2), USB-Sheet (U7.3)
USB_FS_PWR_EN: Controller-Sheet-3 (R76.2), USB-Sheet (R145.1 U6.4)
USB_FS_VBUS: Controller-Sheet-2 (R33.2), USB-Sheet (5 pins)